# Altium schematic sheet THD2528-11SD-GF.schdoc
size 127 x 101 mm
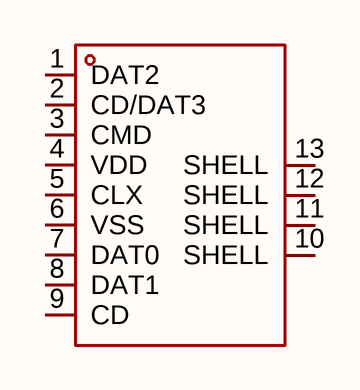
[diagram p0: THD2528-11SD-GF.schdoc]

## Parts
CARD?  thd2528-11sd-gf  [TF-SMD_THD2528-11SD-GF]  (value not drawn)

## Nets

Not connected (* = marked no-connect by the designer): CARD? 1(DAT2) 2(CD/DAT3) 3(CMD) 4(VDD) 5(CLX) 6(VSS) 7(DAT0) 8(DAT1) 9(CD) 10(SHELL) 11(SHELL) 12(SHELL) 13(SHELL)

## Library data of the parts
CARD? = thd2528-11sd-gf: Card Connection Mode:Push-Push Card Type:MicroSD Card (TF Card) Connector Type:Connector and Ejector Additional Card Detection Pins:No Height Above Board:2mm Operating Temperature:- Operating Temperature:-; Manufacturer: THD(台华达); AddInBom: yes; ModelId: 1386afa97a0040b3a0d9dc55a27a422f; ModelTransform: 635.826,598.424,0,0,0,0,0,-82.677,-23.622; Additional Card Detection Pins: No; Symbol: THD2528-11SD-GF; Supplier: LCSC; Supplier Part: C283232; Manufacturer Part: THD2528-11SD-GF; JLCPCB Part Class: Extended Part; LCSC Part Name: 自弹式 MicroSD卡(TF卡) 卡座; Supplier Footprint: SMD; Datasheet: https://item.szlcsc.com/datasheet/THD2528-11SD-GF/268992.html; ConvertToPcb: yes; FootprintName: TF-SMD_THD2528-11SD-GF; ModelName: TF-SMD_THD2528-11SD-GF; Card Connection Mode: Push-Push; Card Type: MicroSD Card (TF Card); Connector Type: Connector and Ejector; Height Above Board: 2mm; Operating Temperature: -